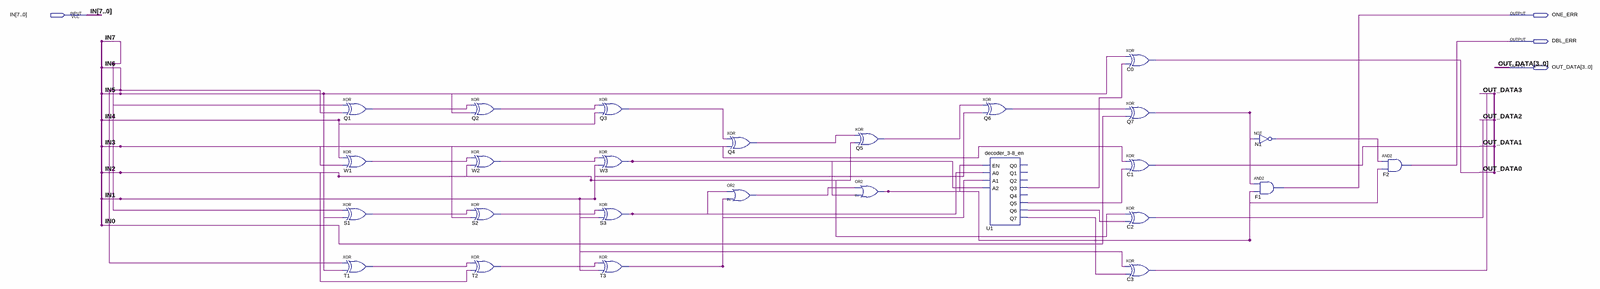
[diagram p0: schematic sheet, whole]
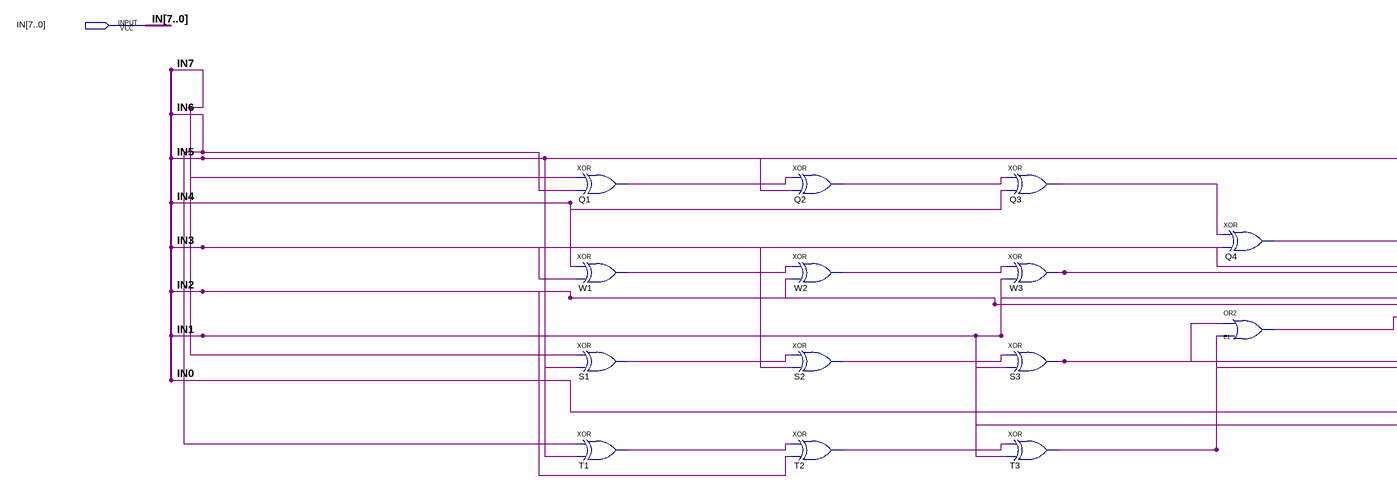
[diagram p1: schematic sheet, left part]
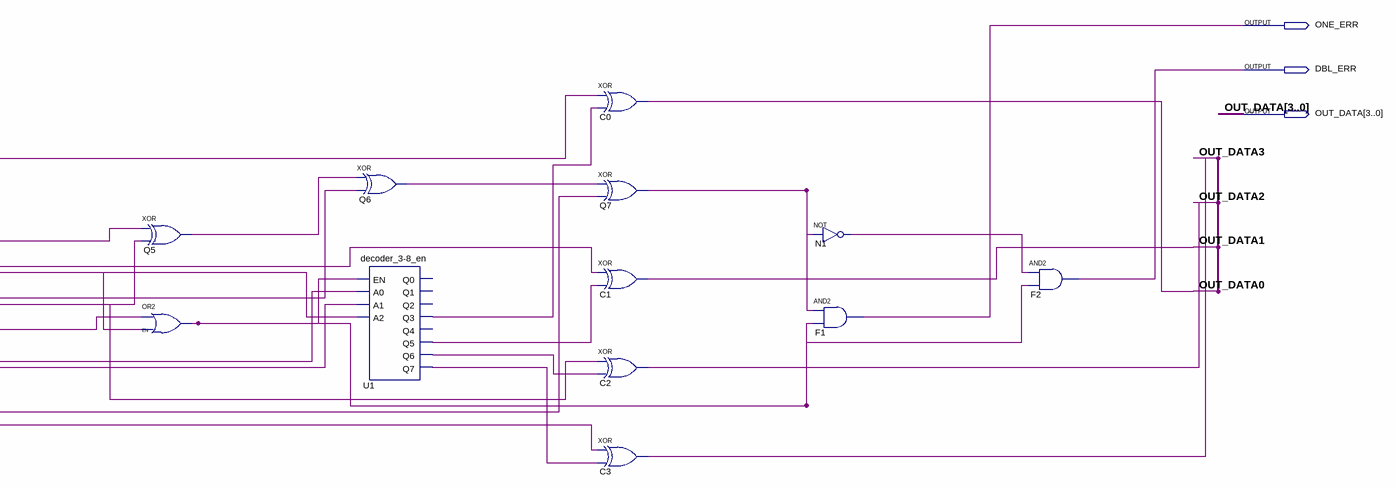
[diagram p2: schematic sheet, right part]
// Quartus schematic decoder.bdf as structural Verilog: 26 symbols, 4 pins
module decoder (
  input  [7:0] IN,
  output ONE_ERR,
  output DBL_ERR,
  output [3:0] OUT_DATA
);

  wire E1_out, EN_out, N1_out, Q1_out, Q2_out, Q3_out, Q4_out, Q5_out, Q6_out, Q7_out, S1_out, S2_out,
       S3_out, T1_out, T2_out, T3_out, U1_q3, U1_q5, U1_q6, U1_q7, W1_out, W2_out, W3_out;

  xor Q1 (Q1_out, IN[7], IN[6]);
  xor W1 (W1_out, IN[4], IN[3]);
  xor S1 (S1_out, IN[7], IN[5]);
  xor T1 (T1_out, IN[6], IN[5]);
  xor Q2 (Q2_out, Q1_out, IN[5]);
  xor W2 (W2_out, W1_out, IN[2]);
  xor S2 (S2_out, S1_out, IN[3]);
  xor T2 (T2_out, T1_out, IN[2]);
  xor Q3 (Q3_out, Q2_out, IN[4]);
  xor W3 (W3_out, W2_out, IN[1]);
  xor S3 (S3_out, S2_out, IN[1]);
  xor T3 (T3_out, T2_out, IN[1]);
  xor Q4 (Q4_out, Q3_out, IN[3]);
  or E1 (E1_out, S3_out, T3_out);
  xor Q5 (Q5_out, Q4_out, IN[2]);
  or EN (EN_out, E1_out, W3_out);
  xor Q6 (Q6_out, Q5_out, IN[1]);
  \decoder_3-8_en  U1 (
    .EN(EN_out), .A0(S3_out), .A1(T3_out), .A2(W3_out), .Q3(U1_q3), .Q5(U1_q5), .Q6(U1_q6), .Q7(U1_q7));  // open: Q0, Q1, Q2, Q4
  xor C0 (OUT_DATA[0], IN[5], U1_q3);
  xor Q7 (Q7_out, Q6_out, IN[0]);
  xor C1 (OUT_DATA[1], IN[3], U1_q5);
  xor C2 (OUT_DATA[2], IN[2], U1_q6);
  xor C3 (OUT_DATA[3], IN[1], U1_q7);
  not N1 (N1_out, Q7_out);
  and F1 (ONE_ERR, Q7_out, EN_out);
  and F2 (DBL_ERR, N1_out, EN_out);
endmodule
